# Altium schematic sheet Camera_Section.SchDoc
size A4; DocumentNumber: 18; SheetNumber: 18; SheetTotal: 28
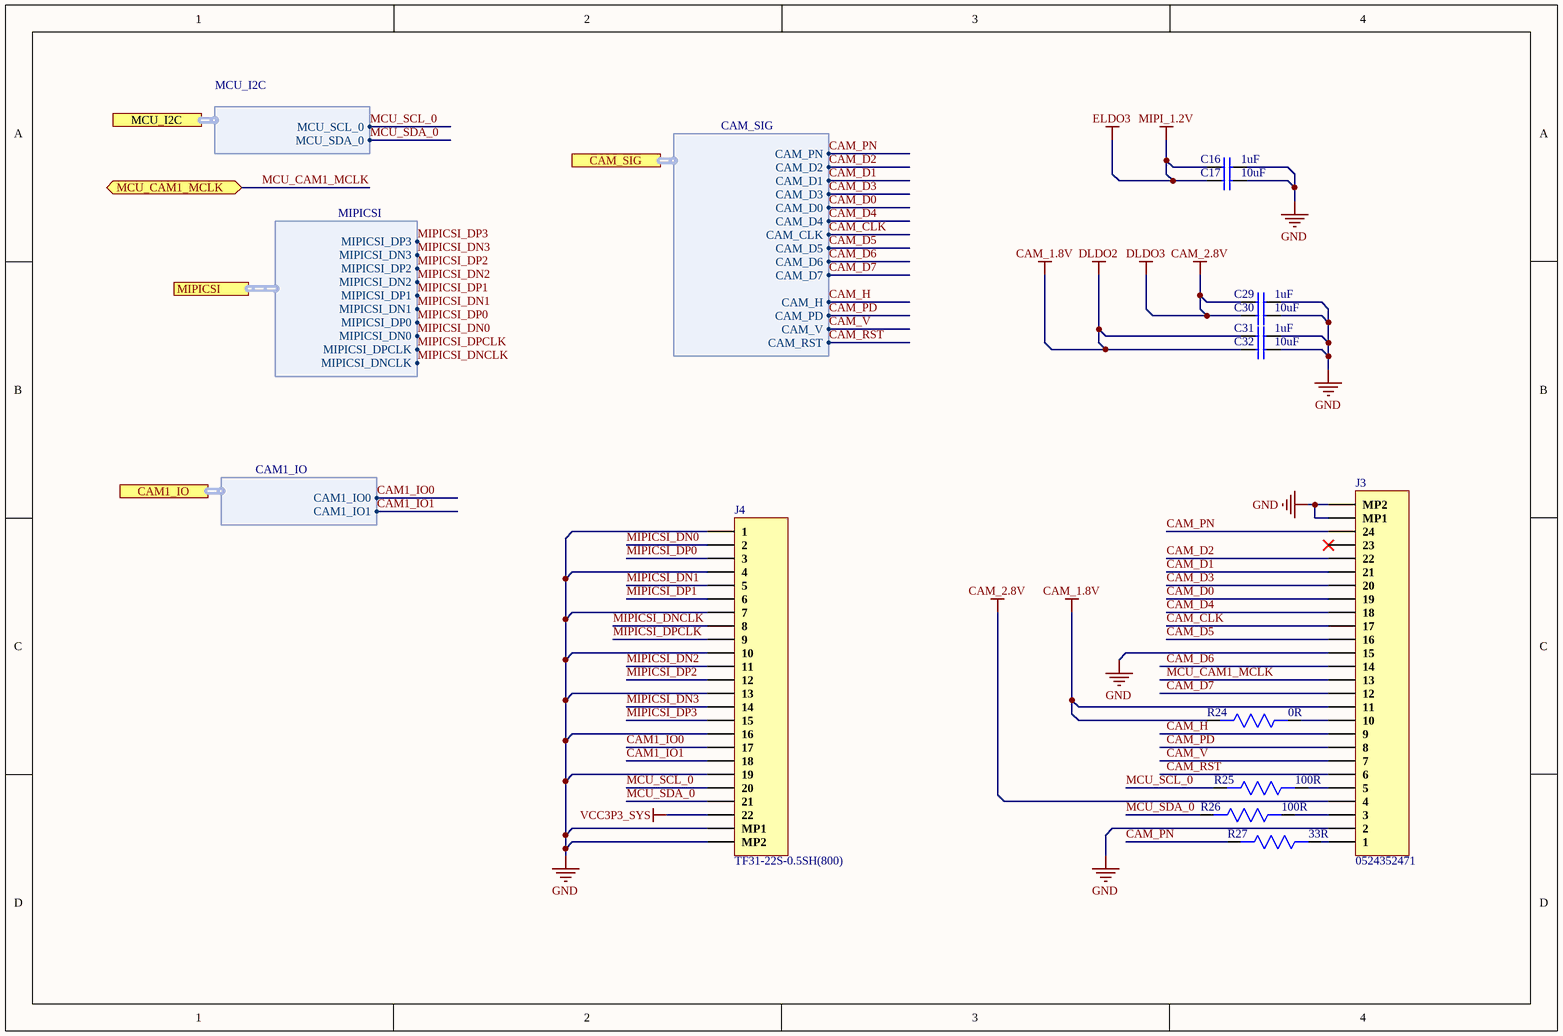
[diagram p0: Camera_Section.SchDoc]

## Parts
C16  1uF  [Cap0603]
C17  10uF  [Cap0603]
C29  1uF  [Cap0603]
C30  10uF  [Cap0603]
C31  1uF  [Cap0603]
C32  10uF  [Cap0603]
J3  0524352471  [0524352471]
J4  TF31-22S-0.5SH(800)  [TF31-22S-0.5SH(800)]
R24  0R  [Res0603]
R25  100R  [Res0603]
R26  100R  [Res0603]
R27  33R  [Res0603]

## Ports
CAM1_IO (harness CAM1_IO), CAM_SIG (harness CAM_SIG), MCU_CAM1_MCLK (bidir), MCU_I2C (harness MCU_I2C), MIPICSI (harness MIPICSI)

## Harnesses
MCU_I2C: MCU_SCL_0, MCU_SDA_0
CAM_SIG: CAM_PN, CAM_D2, CAM_D1, CAM_D3, CAM_D4, CAM_D5, CAM_D6, CAM_D7, CAM_H, CAM_PD, CAM_V, CAM_RST, CAM_CLK, CAM_D0
MIPICSI: MIPICSI_DP3, MIPICSI_DN3, MIPICSI_DP2, MIPICSI_DN2, MIPICSI_DP1, MIPICSI_DN1, MIPICSI_DP0, MIPICSI_DN0, MIPICSI_DPCLK, MIPICSI_DNCLK
CAM1_IO: CAM1_IO0, CAM1_IO1

## Nets
CAM_1.8V: C31.1 C32.1 J3.11 R24.2  [also labelled DLDO2]
CAM_2.8V: C29.1 C30.1 J3.4  [also labelled DLDO3]
ELDO3: C16.1 C17.1  [also labelled MIPI_1.2V]
GND: C16.2 C17.2 C29.2 C30.2 C31.2 C32.2 J3.2 J3.15 J3.MP1 J3.MP2 J4.1 J4.4 J4.7 J4.10 J4.13 J4.16 J4.19 J4.MP1 J4.MP2
VCC3P3_SYS: J4.22
CAM1_IO0: J4.17 ; port CAM1_IO.CAM1_IO0
CAM1_IO1: J4.18 ; port CAM1_IO.CAM1_IO1
CAM_CLK: J3.17 ; port CAM_SIG.CAM_CLK
CAM_D0: J3.19 ; port CAM_SIG.CAM_D0
CAM_D1: J3.21 ; port CAM_SIG.CAM_D1
CAM_D2: J3.22 ; port CAM_SIG.CAM_D2
CAM_D3: J3.20 ; port CAM_SIG.CAM_D3
CAM_D4: J3.18 ; port CAM_SIG.CAM_D4
CAM_D5: J3.16 ; port CAM_SIG.CAM_D5
CAM_D6: J3.14 ; port CAM_SIG.CAM_D6
CAM_D7: J3.12 ; port CAM_SIG.CAM_D7
CAM_H: J3.9 ; port CAM_SIG.CAM_H
CAM_PD: J3.8 ; port CAM_SIG.CAM_PD
CAM_PN: J3.24 R27.2 ; port CAM_SIG.CAM_PN
CAM_RST: J3.6 ; port CAM_SIG.CAM_RST
CAM_V: J3.7 ; port CAM_SIG.CAM_V
MCU_CAM1_MCLK: J3.13 ; port MCU_CAM1_MCLK
MCU_SCL_0: J4.20 R25.2 ; port MCU_I2C.MCU_SCL_0
MCU_SDA_0: J4.21 R26.2 ; port MCU_I2C.MCU_SDA_0
MIPICSI_DN0: J4.2 ; port MIPICSI.MIPICSI_DN0
MIPICSI_DN1: J4.5 ; port MIPICSI.MIPICSI_DN1
MIPICSI_DN2: J4.11 ; port MIPICSI.MIPICSI_DN2
MIPICSI_DN3: J4.14 ; port MIPICSI.MIPICSI_DN3
MIPICSI_DNCLK: J4.8 ; port MIPICSI.MIPICSI_DNCLK
MIPICSI_DP0: J4.3 ; port MIPICSI.MIPICSI_DP0
MIPICSI_DP1: J4.6 ; port MIPICSI.MIPICSI_DP1
MIPICSI_DP2: J4.12 ; port MIPICSI.MIPICSI_DP2
MIPICSI_DP3: J4.15 ; port MIPICSI.MIPICSI_DP3
MIPICSI_DPCLK: J4.9 ; port MIPICSI.MIPICSI_DPCLK
NetJ3_1: J3.1 R27.1
NetJ3_3: J3.3 R26.1
NetJ3_5: J3.5 R25.1
NetJ3_10: J3.10 R24.1

Not connected (* = marked no-connect by the designer): J3 23*

## Library data of the parts
C16 C29 C31 = CC0603KRX5R8BB105: CAP CER 1UF 25V X5R 0603; Manufacturer: Yageo; Tolerance: 10%; Supplier 1: Digi-Key; Manufacturer Part Number: CC0603KRX5R8BB105; Stock 1: 459947; Pricing 1: 1=0.1, 10=0.076, 100=0.0337, 500=0.0241, 1000=0.01894 (USD); Mount: Surface Mount; Case/Package: 0603; Number of Pins: 2; Case Code (Metric): 1608; Case Code (Imperial): 0603; Min Operating Temperature: -55°C; Max Operating Temperature: 85°C; Capacitance: 1uF; Dielectric: X5R; Package Quantity: 1; Voltage Rating: 25V; Packaging: Tape and Reel; Termination: SMD/SMT; Voltage Rating (DC): 25V; Length: 1.6mm; Height: 0.8mm; Width: 0.031inch; Thickness: 0.035inch; Depth: 0.8mm; Radiation Hardening: No; REACH SVHC: No SVHC; Lead Free: Lead Free; Halogen Free: Halogen Free; ComponentLink1URL: http://www.yageo.com/documents/recent/UPY-GPHC_X5R_4V-to-50V_25.pdf?src-supplier=Digi-Key; ComponentLink1Description: http://www.yageo.com/documents/recent/UPY-GPHC_X5R_4V-to-50V_25.pdf?src-supplier=Digi-Key; ComponentLink2URL: http://www.yageo.com/documents/recent/UPY-GPHC_X5R_4V-to-50V_12.pdf?src-supplier=Avnet+Europe; ComponentLink2Description: http://www.yageo.com/documents/recent/UPY-GPHC_X5R_4V-to-50V_12.pdf?src-supplier=Avnet+Europe; ComponentLink3URL: http://www.farnell.com/datasheets/1525783.pdf?src-supplier=Element14; ComponentLink3Description: http://www.farnell.com/datasheets/1525783.pdf?src-supplier=Element14; ComponentLink4URL: http://www.yageo.com/documents/recent/UPY-GPHC_X5R_4V-to-50V_12.pdf?src-supplier=Avnet; ComponentLink4Description: http://www.yageo.com/documents/recent/UPY-GPHC_X5R_4V-to-50V_12.pdf?src-supplier=Avnet; Supplier Part Number 1: 311-1445-1-ND
C17 C30 C32 = GRM188R6YA106MA73D: CAP CER 10UF 35V X5R 0603; Manufacturer: Murata; Tolerance: 20%; Supplier 1: Digi-Key; Manufacturer Part Number: GRM188R6YA106MA73D; Stock 1: 11640; Pricing 1: 1=0.5, 10=0.346, 100=0.2076, 500=0.1557, 1000=0.13148 (USD); Mount: Surface Mount; Case/Package: 0603; Case Code (Metric): 1608; Case Code (Imperial): 0603; Min Operating Temperature: -55°C; Max Operating Temperature: 85°C; Packaging: Tape and Reel; Capacitance: 10uF; Voltage Rating: 35V; Voltage Rating (DC): 35V; Dielectric: X5R; Length: 0.063inch; Width: 0.031inch; Thickness: 0.039inch; ComponentLink1URL: http://search.murata.co.jp/Ceramy/image/img/A01X/G101/ENG/GRM188R6YA106MA73-01.pdf?src-supplier=Digi-Key; ComponentLink1Description: http://search.murata.co.jp/Ceramy/image/img/A01X/G101/ENG/GRM188R6YA106MA73-01.pdf?src-supplier=Digi-Key; ComponentLink2URL: http://search.murata.co.jp/Ceramy/image/img/A01X/G101/ENG/GRM188R6YA106MA73-01.pdf?src-supplier=Mouser; ComponentLink2Description: http://search.murata.co.jp/Ceramy/image/img/A01X/G101/ENG/GRM188R6YA106MA73-01.pdf?src-supplier=Mouser; ComponentLink3URL: https://www.murata.com/~/media/webrenewal/support/library/catalog/products/capacitor/mlcc/c02e.ashx?la=en-us&src-supplier=Digi-Key; ComponentLink3Description: https://www.murata.com/~/media/webrenewal/support/library/catalog/products/capacitor/mlcc/c02e.ashx?la=en-us&src-supplier=Digi-Key; ComponentLink4URL: http://search.murata.co.jp/Ceramy/image/img/A01X/G101/ENG/GRM188R6YA106MA73-01.pdf?src-supplier=Future+Electronics; ComponentLink4Description: http://search.murata.co.jp/Ceramy/image/img/A01X/G101/ENG/GRM188R6YA106MA73-01.pdf?src-supplier=Future+Electronics; ComponentLink5URL: http://search.murata.co.jp/Ceramy/image/img/A01X/G101/ENG/GRM188R6YA106MA73-01.pdf?src-supplier=TTI; ComponentLink5Description: http://search.murata.co.jp/Ceramy/image/img/A01X/G101/ENG/GRM188R6YA106MA73-01.pdf?src-supplier=TTI; Supplier Part Number 1: 490-13248-6-ND
J3 = 0524352471: CONN FFC TOP 24POS 0.50MM R/A; Manufacturer: Molex; Manufacturer Part Number: 52435-2471; Current Rating: 500mA; Voltage Rating: 50V; Number of Positions: 24; Max Voltage Rating (DC): 5.05kV; Gender: Receptacle; Stackable: No; Pitch: 0.5mm; Supplier 1: Digi-Key; RoHS: Yes; Category: FFC / FPC; Stock 1: 1377; Pricing 1: 1=2.22000, 10=1.89200, 100=1.56290 (USD); Contact Material: Bronze; Contact Plating: Gold; Housing Material: Nylon; Min Operating Temperature: -40°C; Max Operating Temperature: 85°C; Packaging: Tape and Reel; Termination: Solder; Package Quantity: 1000; Number of Rows: 1; Number of Contacts: 24; Max Voltage Rating (AC): 50V; Orientation: Right Angle; Contact Location: Top; Number of Circuits: 24; Length: 18.6mm; Depth: 4.7mm; Radiation Hardening: No; REACH SVHC: Unknown; ComponentLink1URL: https://datasheet.ciiva.com/1484/1629121-1484657.pdf?src-supplier=Newark; ComponentLink1Description: https://datasheet.ciiva.com/1484/1629121-1484657.pdf?src-supplier=Newark; ComponentLink2URL: https://datasheet.ciiva.com/5137/0524352471-ffc-fpc-connectors-170593-5137745.pdf?src-supplier=Mouser; ComponentLink2Description: https://datasheet.ciiva.com/5137/0524352471-ffc-fpc-connectors-170593-5137745.pdf?src-supplier=Mouser; ComponentLink3URL: https://datasheet.ciiva.com/30088/283130524352471-ffc-fpc-nectors-30088679.pdf?src-supplier=Onlinecomponents.com; ComponentLink3Description: https://datasheet.ciiva.com/30088/283130524352471-ffc-fpc-nectors-30088679.pdf?src-supplier=Onlinecomponents.com; ComponentLink4URL: https://datasheet.ciiva.com/3925/128320524352471-ffc-fpc-nectors-3925353.pdf?src-supplier=Arrow+Electronics; ComponentLink4Description: https://datasheet.ciiva.com/3925/128320524352471-ffc-fpc-nectors-3925353.pdf?src-supplier=Arrow+Electronics; ComponentLink5URL: https://datasheet.ciiva.com/16659/0524352471-ffc-fpc-connectors-16659957.pdf?src-supplier=Avnet+Europe; ComponentLink5Description: https://datasheet.ciiva.com/16659/0524352471-ffc-fpc-connectors-16659957.pdf?src-supplier=Avnet+Europe; ComponentLink6URL: https://datasheet.ciiva.com/8038/1597798-8038390.pdf?src-supplier=Element14; ComponentLink6Description: https://datasheet.ciiva.com/8038/1597798-8038390.pdf?src-supplier=Element14; ComponentLink7URL: https://datasheet.ciiva.com/10364/0524352471-ffc-fpc-connectors-10364236.pdf?src-supplier=Avnet; ComponentLink7Description: https://datasheet.ciiva.com/10364/0524352471-ffc-fpc-connectors-10364236.pdf?src-supplier=Avnet; Supplier Part Number 1: WM7975CT-ND
J4 = TF31-22S-0.5SH(800): CONN FFC 22POS 0.50MM SMD; Manufacturer: Hirose; Supplier 1: Digi-Key; Manufacturer Part Number: TF31-22S-0.5SH(800); RoHS: Yes; Stock 1: 14399; Pricing 1: 1=0.46000, 10=0.43100, 25=0.36920, 50=0.31360, 100=0.30140, 250=0.27060, 500=0.25830, 1000=0.21525 (USD); RoHS Compliant: No; Supplier Part Number 1: 26-TF31-22S-0.5SH(800)CT-ND
R24 = RC0603FR-070RL: RES SMD 0R, 1%, 0.1W, 0603; Manufacturer: Yageo; Resistance: 0mR; Power Rating: 100mW; Voltage Rating (DC): 50V; Temperature Coefficient: 200ppm/°C; Current Rating: 1A; Working Voltage: 75V; Supplier 1: Arrow Electronics; Manufacturer Part Number: RC0603FR-070RL; RoHS: Yes; Category: Chip SMD Resistors; Stock 1: 1270000; Pricing 1: 5000=0.00320, 5000=0.00490, 50000=0.00450, 500000=0.00250, 2500000=0.00150 (USD); Case/Package: 0603; Number of Pins: 2; Contact Plating: Tin,Matte; Case Code (Metric): 1608; Case Code (Imperial): 0603; Min Operating Temperature: -55°C; Max Operating Temperature: 155°C; Resistor Type: Thick Film; Packaging: Tape and Reel; Tolerance: 1%; Package Quantity: 5000; Voltage Rating: 50V; Number of Terminations: 2; Termination: SMD/SMT; Max Power Dissipation: 100mW; Features: Moisture Resistant; Length: 1.6mm; Width: 0.031inch; Height: 0.45mm; Depth: 0.8mm; Radiation Hardening: No; REACH SVHC: No SVHC; Lead Free: Lead Free; Military Standard: Not; ComponentLink1URL: https://datasheet.ciiva.com/11808/0900766b80f96399-11808172.pdf?src-supplier=RSComponents; ComponentLink1Description: https://datasheet.ciiva.com/11808/0900766b80f96399-11808172.pdf?src-supplier=RSComponents; ComponentLink2URL: https://datasheet.ciiva.com/5558/rc0603-272842-5558341.pdf?src-supplier=Mouser; ComponentLink2Description: https://datasheet.ciiva.com/5558/rc0603-272842-5558341.pdf?src-supplier=Mouser; ComponentLink3URL: https://datasheet.ciiva.com/46382/443971-46382072.pdf?src-supplier=Element14; ComponentLink3Description: https://datasheet.ciiva.com/46382/443971-46382072.pdf?src-supplier=Element14; ComponentLink4URL: https://datasheet.ciiva.com/29721/pyu-r-int-thick-7-29721178.pdf?src-supplier=Digi-Key; ComponentLink4Description: https://datasheet.ciiva.com/29721/pyu-r-int-thick-7-29721178.pdf?src-supplier=Digi-Key; ComponentLink5URL: https://datasheet.ciiva.com/5684/443971-5684699.pdf?src-supplier=Farnell; ComponentLink5Description: https://datasheet.ciiva.com/5684/443971-5684699.pdf?src-supplier=Farnell; ComponentLink6URL: https://datasheet.ciiva.com/7983/443971-7983627.pdf?src-supplier=Element14; ComponentLink6Description: https://datasheet.ciiva.com/7983/443971-7983627.pdf?src-supplier=Element14; ComponentLink7URL: https://datasheet.ciiva.com/29721/pyu-rc0603-51-rohs-l-4-29721179.pdf?src-supplier=Digi-Key; ComponentLink7Description: https://datasheet.ciiva.com/29721/pyu-rc0603-51-rohs-l-4-29721179.pdf?src-supplier=Digi-Key; ComponentLink8URL: https://datasheet.ciiva.com/22643/1868787-22643388.pdf?src-supplier=Element14; ComponentLink8Description: https://datasheet.ciiva.com/22643/1868787-22643388.pdf?src-supplier=Element14; Supplier Part Number 1: RC0603FR-070RL
R25 R26 = RC0603FR-07100RL: RES SMD 100 OHM 1% 1/10W 0603; Manufacturer: Yageo; Temperature Coefficient: 100ppm/°C; Voltage Rating (DC): 50V; Power Rating: 100mW; Supplier 1: Arrow Electronics; Manufacturer Part Number: RC0603FR-07100RL; RoHS: Yes; Category: Chip SMD Resistors; Stock 1: 3800000; Pricing 1: 5000=0.00300, 5000=0.00200, 5000=0.00450, 50000=0.00410, 500000=0.00230, 2500000=0.00140 (USD); Case/Package: 0603; Number of Pins: 2; Case Code (Imperial): 0603; Case Code (Metric): 1608; Size Code: 0603; Min Operating Temperature: -55°C; Max Operating Temperature: 155°C; Resistance: 100R; Tolerance: 1%; Resistor Type: Thick Film; Packaging: Tape and Reel; Voltage Rating: 50V; Termination: SMD/SMT; Features: Moisture Resistant; Series: RC; Max Power Dissipation: 100mW; Number of Terminations: 2; Construction: Rectangular; Resistance Tolerance: 1%; Technology: THICK FILM; Length: 1.6mm; Width: 0.8mm; Height: 0.45mm; Depth: 0.8mm; REACH SVHC: Unknown; Lead Free: Lead Free; RoHS Compliant: Yes; Military Standard: Not; Supplier Part Number 1: RC0603FR-07100RL
R27 = RC0603FR-0733RL: RES SMD 0603 33 Ohm 1% 1/10W; Manufacturer: Yageo; Temperature Coefficient: 100ppm/°C; Voltage Rating (DC): 50V; Power Rating: 100mW; Voltage Rating: 75V; Supplier 1: Digi-Key; Manufacturer Part Number: RC0603FR-0733RL; RoHS: Yes; Category: Chip SMD Resistors; Stock 1: 41; Pricing 1: 1=0.10000, 10=0.02400, 100=0.00970, 1000=0.00436, 2500=0.00378 (USD); Case/Package: 0603; Number of Pins: 2; Case Code (Metric): 1608; Case Code (Imperial): 0603; Weight: 7.1E-05oz; Size Code: 0603; Min Operating Temperature: -55°C; Max Operating Temperature: 155°C; Resistance: 33R; Tolerance: 1%; Resistor Type: Thick Film; Packaging: Tape and Reel; Package Quantity: 1; Number of Terminations: 2; Termination: SMD/SMT; Max Power Dissipation: 100mW; Features: Moisture Resistant; Series: RC; Resistance Tolerance: 1%; Technology: THICK FILM; Construction: Rectangular; Length: 1.6mm; Width: 0.8mm; Height: 0.45mm; Depth: 0.8mm; Lead Pitch: 0.3mm; REACH SVHC: No SVHC; Lead Free: Lead Free; Military Standard: Not; RoHS Compliant: Yes; ComponentLink1URL: https://datasheet.ciiva.com/11808/0900766b80f96399-11808741.pdf?src-supplier=RSComponents; ComponentLink1Description: https://datasheet.ciiva.com/11808/0900766b80f96399-11808741.pdf?src-supplier=RSComponents; ComponentLink2URL: https://datasheet.ciiva.com/2453/pyu-r-int-thick-7-2453952.pdf?src-supplier=Digi-Key; ComponentLink2Description: https://datasheet.ciiva.com/2453/pyu-r-int-thick-7-2453952.pdf?src-supplier=Digi-Key; ComponentLink3URL: https://datasheet.ciiva.com/2453/pyu-r-int-thick-7-2453953.pdf?src-supplier=Digi-Key; ComponentLink3Description: https://datasheet.ciiva.com/2453/pyu-r-int-thick-7-2453953.pdf?src-supplier=Digi-Key; ComponentLink4URL: https://datasheet.ciiva.com/2453/pyu-r-int-thick-7-2453954.pdf?src-supplier=Digi-Key; ComponentLink4Description: https://datasheet.ciiva.com/2453/pyu-r-int-thick-7-2453954.pdf?src-supplier=Digi-Key; ComponentLink5URL: https://datasheet.ciiva.com/7660/38590-7660792.pdf?src-supplier=Element14; ComponentLink5Description: https://datasheet.ciiva.com/7660/38590-7660792.pdf?src-supplier=Element14; ComponentLink6URL: https://datasheet.ciiva.com/15189/getdatasheetpartid-326673-15189708.pdf?src-supplier=Verical; ComponentLink6Description: https://datasheet.ciiva.com/15189/getdatasheetpartid-326673-15189708.pdf?src-supplier=Verical; ComponentLink7URL: https://datasheet.ciiva.com/7746/443971-7746334.pdf?src-supplier=Element14; ComponentLink7Description: https://datasheet.ciiva.com/7746/443971-7746334.pdf?src-supplier=Element14; ComponentLink8URL: https://datasheet.ciiva.com/7746/443971-7746335.pdf?src-supplier=Element14; ComponentLink8Description: https://datasheet.ciiva.com/7746/443971-7746335.pdf?src-supplier=Element14; ComponentLink9URL: https://datasheet.ciiva.com/46395/443971-46395007.pdf?src-supplier=Element14; ComponentLink9Description: https://datasheet.ciiva.com/46395/443971-46395007.pdf?src-supplier=Element14; Supplier Part Number 1: 311-33.0HRCT-ND